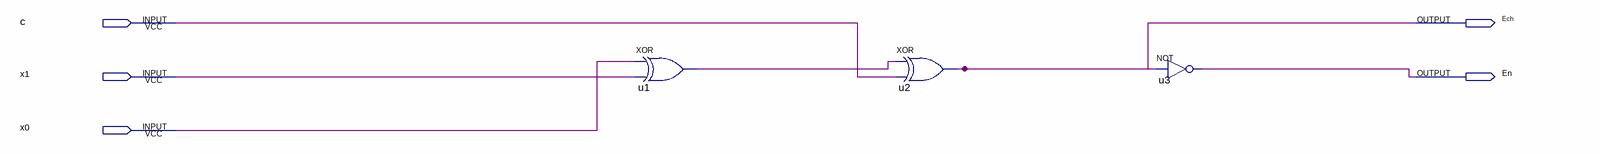
[diagram p0: schematic sheet]
// Quartus schematic parity2.bdf as structural Verilog: 3 symbols, 5 pins
module parity2 (
  input  c,
  input  x1,
  input  x0,
  output Ech,
  output En
);

  wire u1_out;

  xor u1 (u1_out, x0, x1);
  xor u2 (Ech, u1_out, c);
  not u3 (En, Ech);
endmodule
